# Altium schematic sheet Servo_Power.SchDoc
size A; DocumentNumber: 6; SheetNumber: 6; SheetTotal: 14
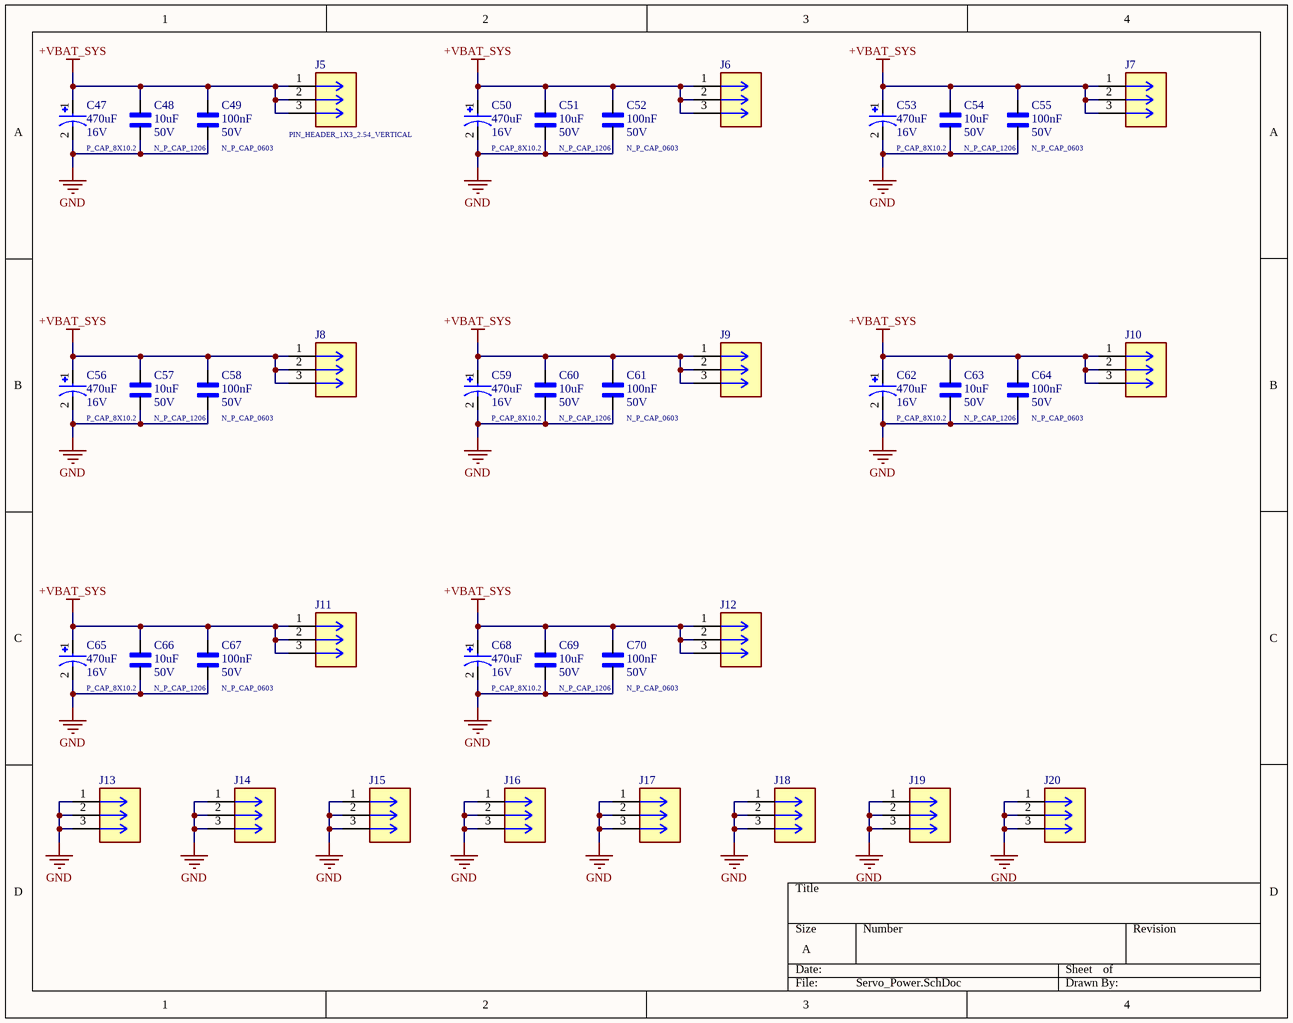
[diagram p0: Servo_Power.SchDoc]

## Parts
C47  P_CAP_8X10.2  value 470uF  Rated Voltage: 16V  [P_CAP_8X10.2]
C48  N_P_CAP_1206  value 10uF  Rated Voltage: 50V  [N_P_CAP_1206]
C49  N_P_CAP_0603  value 100nF  Rated Voltage: 50V  [N_P_CAP_0603]
C50  P_CAP_8X10.2  value 470uF  Rated Voltage: 16V  [P_CAP_8X10.2]
C51  N_P_CAP_1206  value 10uF  Rated Voltage: 50V  [N_P_CAP_1206]
C52  N_P_CAP_0603  value 100nF  Rated Voltage: 50V  [N_P_CAP_0603]
C53  P_CAP_8X10.2  value 470uF  Rated Voltage: 16V  [P_CAP_8X10.2]
C54  N_P_CAP_1206  value 10uF  Rated Voltage: 50V  [N_P_CAP_1206]
C55  N_P_CAP_0603  value 100nF  Rated Voltage: 50V  [N_P_CAP_0603]
C56  P_CAP_8X10.2  value 470uF  Rated Voltage: 16V  [P_CAP_8X10.2]
C57  N_P_CAP_1206  value 10uF  Rated Voltage: 50V  [N_P_CAP_1206]
C58  N_P_CAP_0603  value 100nF  Rated Voltage: 50V  [N_P_CAP_0603]
C59  P_CAP_8X10.2  value 470uF  Rated Voltage: 16V  [P_CAP_8X10.2]
C60  N_P_CAP_1206  value 10uF  Rated Voltage: 50V  [N_P_CAP_1206]
C61  N_P_CAP_0603  value 100nF  Rated Voltage: 50V  [N_P_CAP_0603]
C62  P_CAP_8X10.2  value 470uF  Rated Voltage: 16V  [P_CAP_8X10.2]
C63  N_P_CAP_1206  value 10uF  Rated Voltage: 50V  [N_P_CAP_1206]
C64  N_P_CAP_0603  value 100nF  Rated Voltage: 50V  [N_P_CAP_0603]
C65  P_CAP_8X10.2  value 470uF  Rated Voltage: 16V  [P_CAP_8X10.2]
C66  N_P_CAP_1206  value 10uF  Rated Voltage: 50V  [N_P_CAP_1206]
C67  N_P_CAP_0603  value 100nF  Rated Voltage: 50V  [N_P_CAP_0603]
C68  P_CAP_8X10.2  value 470uF  Rated Voltage: 16V  [P_CAP_8X10.2]
C69  N_P_CAP_1206  value 10uF  Rated Voltage: 50V  [N_P_CAP_1206]
C70  N_P_CAP_0603  value 100nF  Rated Voltage: 50V  [N_P_CAP_0603]
J5  PIN_HEADER_1X3_2.54_VERTICAL  [PIN_HEADER_1X3_2.54_VERTICAL]
J6  PIN_HEADER_1X3_2.54_VERTICAL  [PIN_HEADER_1X3_2.54_VERTICAL]  (value not drawn)
J7  PIN_HEADER_1X3_2.54_VERTICAL  [PIN_HEADER_1X3_2.54_VERTICAL]  (value not drawn)
J8  PIN_HEADER_1X3_2.54_VERTICAL  [PIN_HEADER_1X3_2.54_VERTICAL]  (value not drawn)
J9  PIN_HEADER_1X3_2.54_VERTICAL  [PIN_HEADER_1X3_2.54_VERTICAL]  (value not drawn)
J10  PIN_HEADER_1X3_2.54_VERTICAL  [PIN_HEADER_1X3_2.54_VERTICAL]  (value not drawn)
J11  PIN_HEADER_1X3_2.54_VERTICAL  [PIN_HEADER_1X3_2.54_VERTICAL]  (value not drawn)
J12  PIN_HEADER_1X3_2.54_VERTICAL  [PIN_HEADER_1X3_2.54_VERTICAL]  (value not drawn)
J13  PIN_HEADER_1X3_2.54_VERTICAL  [PIN_HEADER_1X3_2.54_VERTICAL]  (value not drawn)
J14  PIN_HEADER_1X3_2.54_VERTICAL  [PIN_HEADER_1X3_2.54_VERTICAL]  (value not drawn)
J15  PIN_HEADER_1X3_2.54_VERTICAL  [PIN_HEADER_1X3_2.54_VERTICAL]  (value not drawn)
J16  PIN_HEADER_1X3_2.54_VERTICAL  [PIN_HEADER_1X3_2.54_VERTICAL]  (value not drawn)
J17  PIN_HEADER_1X3_2.54_VERTICAL  [PIN_HEADER_1X3_2.54_VERTICAL]  (value not drawn)
J18  PIN_HEADER_1X3_2.54_VERTICAL  [PIN_HEADER_1X3_2.54_VERTICAL]  (value not drawn)
J19  PIN_HEADER_1X3_2.54_VERTICAL  [PIN_HEADER_1X3_2.54_VERTICAL]  (value not drawn)
J20  PIN_HEADER_1X3_2.54_VERTICAL  [PIN_HEADER_1X3_2.54_VERTICAL]  (value not drawn)

## Nets
+VBAT_SYS: C47.1(A) C48.2 C49.2 C50.1(A) C51.2 C52.2 C53.1(A) C54.2 C55.2 C56.1(A) C57.2 C58.2 C59.1(A) C60.2 C61.2 C62.1(A) C63.2 C64.2 C65.1(A) C66.2 C67.2 C68.1(A) C69.2 C70.2 J5.1 J5.2 J5.3 J6.1 J6.2 J6.3 J7.1 J7.2 J7.3 J8.1 J8.2 J8.3 J9.1 J9.2 J9.3 J10.1 J10.2 J10.3 J11.1 J11.2 J11.3 J12.1 J12.2 J12.3
GND: C47.2(K) C48.1 C49.1 C50.2(K) C51.1 C52.1 C53.2(K) C54.1 C55.1 C56.2(K) C57.1 C58.1 C59.2(K) C60.1 C61.1 C62.2(K) C63.1 C64.1 C65.2(K) C66.1 C67.1 C68.2(K) C69.1 C70.1 J13.1 J13.2 J13.3 J14.1 J14.2 J14.3 J15.1 J15.2 J15.3 J16.1 J16.2 J16.3 J17.1 J17.2 J17.3 J18.1 J18.2 J18.3 J19.1 J19.2 J19.3 J20.1 J20.2 J20.3

## Library data of the parts
C47 C50 C53 C56 C59 C62 C65 C68 = P_CAP: GENERIC POLARIZED CAP; MF: *; MPN: *; LCSC Part Number: C79121; Tolerance: *; ESR: *; Capacitor Type: *; Ripple Current: *
C48 C49 C51 C52 C54 C55 C57 C58 C60 C61 C63 C64 C66 C67 C69 C70 = N_P_CAP: GENERIC NON-POLARIZED CAP; Tolerance: *; MF: *; ESR: *; MPN: *; Temperature Coefficient: *
  C48 C51 C54 C57 C60 C63 C66 C69: LCSC Part Number: C100122
  C49 C52 C55 C58 C61 C64 C67 C70: LCSC Part Number: C106221
J5-J20 = PIN_HEADER_3P: GENERIC PIN HEADER 3P; MPN: 10129378-903001BLF; MF: Amphenol; LCSC Part Number: C5470076